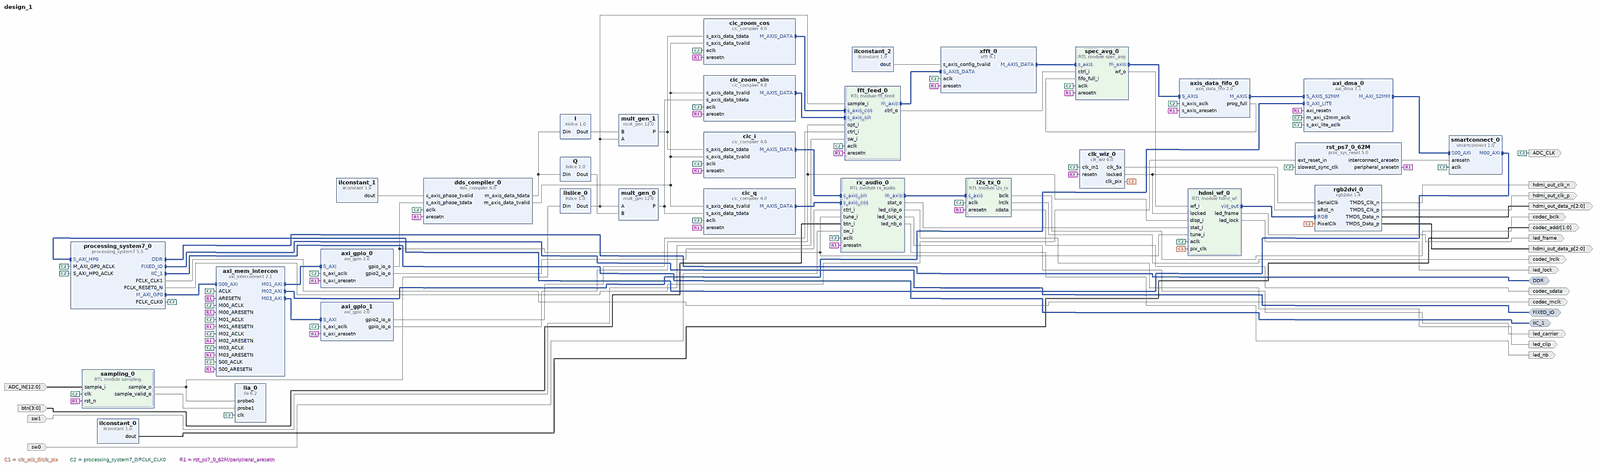
[diagram p0: block diagram of the top level, whole]
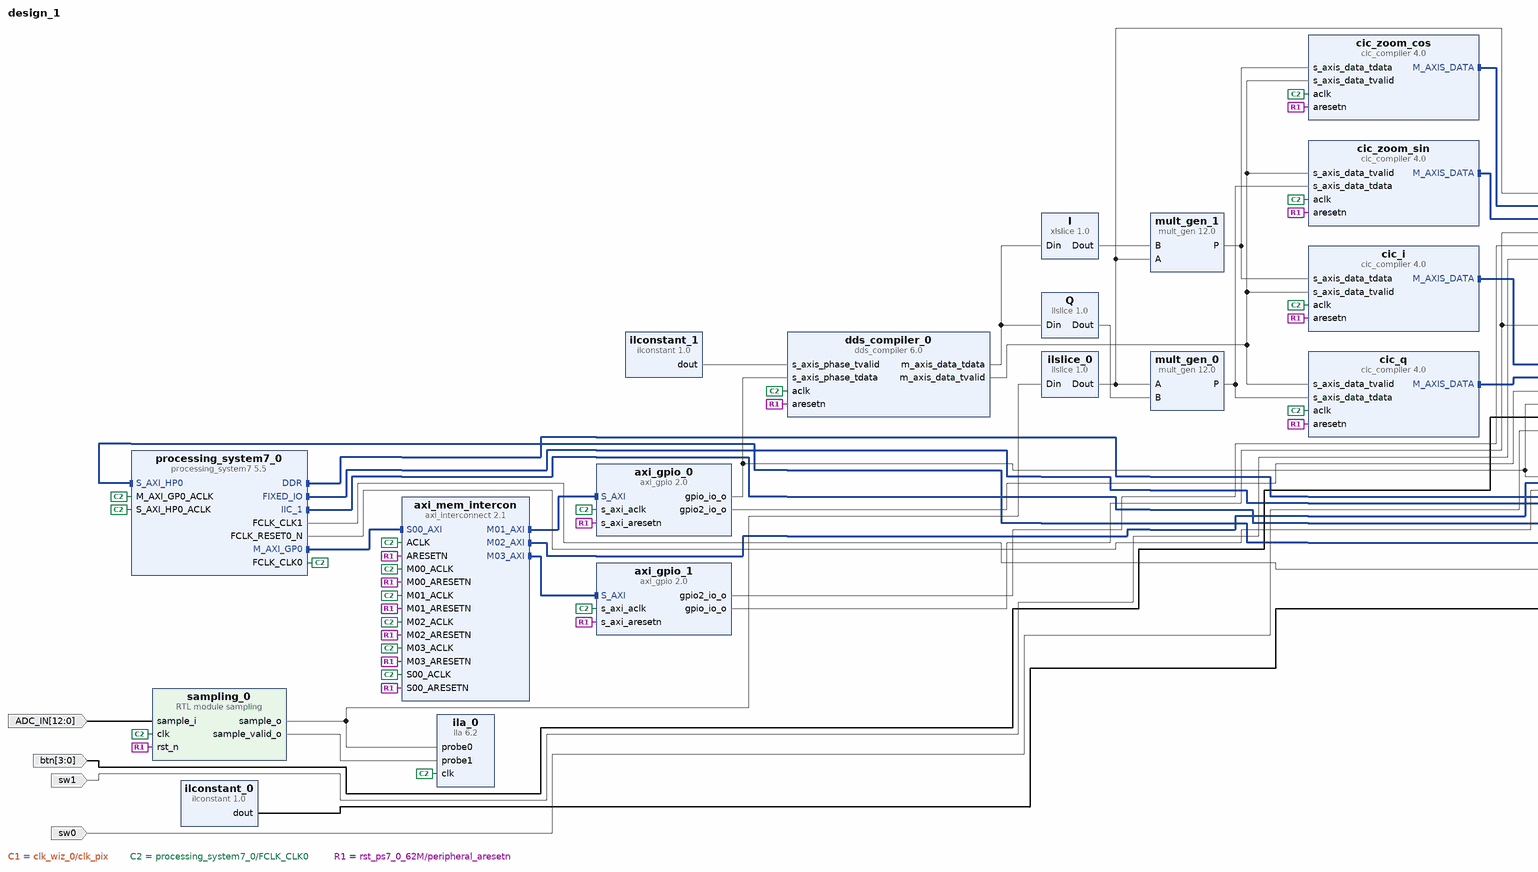
[diagram p1: block diagram of the top level, left part]
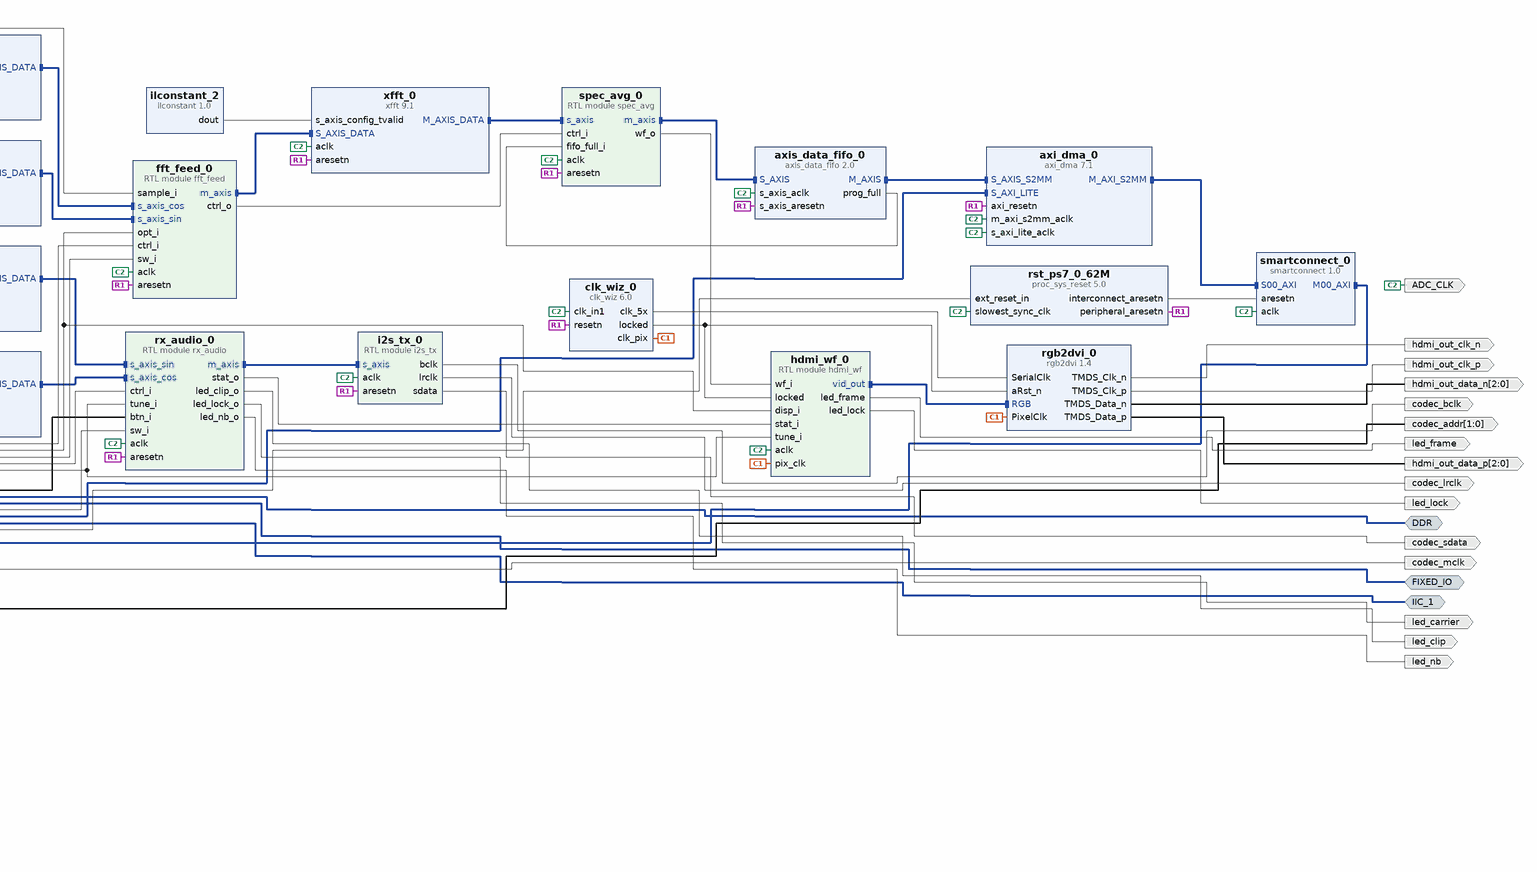
[diagram p2: block diagram of the top level, right part]
# Vivado block design design_1, xc7z020clg400-1, Vivado 2025.2
create_bd_design design_1

create_bd_intf_port -mode Master -vlnv xilinx.com:interface:ddrx_rtl:1.0 DDR
create_bd_intf_port -mode Master -vlnv xilinx.com:display_processing_system7:fixedio_rtl:1.0 FIXED_IO
create_bd_intf_port -mode Master -vlnv xilinx.com:interface:iic_rtl:1.0 IIC_1
create_bd_port -dir I -from 12 -to 0 -type data ADC_IN
create_bd_port -dir O ADC_CLK
create_bd_port -dir O codec_bclk
create_bd_port -dir O codec_lrclk
create_bd_port -dir O codec_sdata
create_bd_port -dir O -from 1 -to 0 codec_addr
create_bd_port -dir O codec_mclk
create_bd_port -dir O -type clk hdmi_out_clk_p
create_bd_port -dir O -type clk hdmi_out_clk_n
create_bd_port -dir O -from 2 -to 0 hdmi_out_data_p
create_bd_port -dir O -from 2 -to 0 hdmi_out_data_n
create_bd_port -dir O led_lock
create_bd_port -dir O led_frame
create_bd_port -dir I sw1
create_bd_port -dir I -from 3 -to 0 btn
create_bd_port -dir O led_carrier
create_bd_port -dir O led_clip
create_bd_port -dir I sw0
create_bd_port -dir O led_nb

create_bd_cell -type ip -vlnv xilinx.com:ip:processing_system7:5.5 processing_system7_0
set_property -dict [list \
  CONFIG.PCW_APU_PERIPHERAL_FREQMHZ 650 \
  CONFIG.PCW_CRYSTAL_PERIPHERAL_FREQMHZ 50 \
  CONFIG.PCW_ENET0_ENET0_IO {MIO 16 .. 27} \
  CONFIG.PCW_ENET0_GRP_MDIO_ENABLE 1 \
  CONFIG.PCW_ENET0_GRP_MDIO_IO {MIO 52 .. 53} \
  CONFIG.PCW_ENET0_PERIPHERAL_ENABLE 1 \
  CONFIG.PCW_ENET0_RESET_ENABLE 1 \
  CONFIG.PCW_ENET0_RESET_IO {MIO 9} \
  CONFIG.PCW_ENET_RESET_ENABLE 1 \
  CONFIG.PCW_ENET_RESET_SELECT {Share reset pin} \
  CONFIG.PCW_EN_CLK1_PORT 1 \
  CONFIG.PCW_FPGA0_PERIPHERAL_FREQMHZ 62.5 \
  CONFIG.PCW_FPGA1_PERIPHERAL_FREQMHZ 12.5 \
  CONFIG.PCW_FPGA_FCLK1_ENABLE 1 \
  CONFIG.PCW_GPIO_MIO_GPIO_ENABLE 1 \
  CONFIG.PCW_GPIO_MIO_GPIO_IO MIO \
  CONFIG.PCW_I2C1_I2C1_IO EMIO \
  CONFIG.PCW_I2C1_PERIPHERAL_ENABLE 1 \
  CONFIG.PCW_I2C_PERIPHERAL_FREQMHZ 108.333336 \
  CONFIG.PCW_I2C_RESET_ENABLE 1 \
  CONFIG.PCW_I2C_RESET_SELECT {Share reset pin} \
  CONFIG.PCW_M_AXI_GP0_FREQMHZ 10 \
  CONFIG.PCW_PERIPHERAL_BOARD_PRESET part0 \
  CONFIG.PCW_PRESET_BANK1_VOLTAGE {LVCMOS 1.8V} \
  CONFIG.PCW_QSPI_GRP_FBCLK_ENABLE 1 \
  CONFIG.PCW_QSPI_GRP_FBCLK_IO {MIO 8} \
  CONFIG.PCW_QSPI_GRP_SINGLE_SS_ENABLE 1 \
  CONFIG.PCW_QSPI_GRP_SINGLE_SS_IO {MIO 1 .. 6} \
  CONFIG.PCW_QSPI_PERIPHERAL_ENABLE 1 \
  CONFIG.PCW_QSPI_QSPI_IO {MIO 1 .. 6} \
  CONFIG.PCW_SD0_GRP_CD_ENABLE 1 \
  CONFIG.PCW_SD0_GRP_CD_IO {MIO 47} \
  CONFIG.PCW_SD0_GRP_WP_ENABLE 0 \
  CONFIG.PCW_SD0_PERIPHERAL_ENABLE 1 \
  CONFIG.PCW_SD0_SD0_IO {MIO 40 .. 45} \
  CONFIG.PCW_SDIO_PERIPHERAL_FREQMHZ 50 \
  CONFIG.PCW_SINGLE_QSPI_DATA_MODE x4 \
  CONFIG.PCW_UART0_PERIPHERAL_ENABLE 1 \
  CONFIG.PCW_UART0_UART0_IO {MIO 14 .. 15} \
  CONFIG.PCW_UART1_PERIPHERAL_ENABLE 0 \
  CONFIG.PCW_UART_PERIPHERAL_FREQMHZ 100 \
  CONFIG.PCW_UIPARAM_DDR_BUS_WIDTH {16 Bit} \
  CONFIG.PCW_UIPARAM_DDR_FREQ_MHZ 525 \
  CONFIG.PCW_UIPARAM_DDR_PARTNO {MT41J256M16 RE-125} \
  CONFIG.PCW_USB0_PERIPHERAL_ENABLE 1 \
  CONFIG.PCW_USB0_RESET_ENABLE 1 \
  CONFIG.PCW_USB0_RESET_IO {MIO 46} \
  CONFIG.PCW_USB0_USB0_IO {MIO 28 .. 39} \
  CONFIG.PCW_USB_RESET_ENABLE 1 \
  CONFIG.PCW_USB_RESET_SELECT {Share reset pin} \
  CONFIG.PCW_USE_S_AXI_HP0 1 \
] [get_bd_cells processing_system7_0]
# 482 more settings of processing_system7_0 are not shown: defaults, MIO pin electricals, DDR timing, and values the tool derives
create_bd_cell -type module -reference sampling sampling_0
create_bd_cell -type inline_hdl -vlnv xilinx.com:inline_hdl:ilslice:1.0 ilslice_0
set_property -dict {CONFIG.DIN_FROM 11 CONFIG.DIN_TO 0 CONFIG.DIN_WIDTH 13} [get_bd_cells ilslice_0]
create_bd_cell -type ip -vlnv xilinx.com:ip:proc_sys_reset:5.0 rst_ps7_0_62M
create_bd_cell -type ip -vlnv xilinx.com:ip:ila:6.2 ila_0
set_property -dict [list \
  CONFIG.C_DATA_DEPTH 8192 \
  CONFIG.C_EN_STRG_QUAL 1 \
  CONFIG.C_MONITOR_TYPE Native \
  CONFIG.C_NUM_OF_PROBES 2 \
] [get_bd_cells ila_0]
create_bd_cell -type ip -vlnv xilinx.com:ip:axi_interconnect:2.1 axi_mem_intercon
set_property -dict {CONFIG.NUM_MI 4 CONFIG.NUM_SI 1} [get_bd_cells axi_mem_intercon]
create_bd_cell -type ip -vlnv xilinx.com:ip:dds_compiler:6.0 dds_compiler_0
set_property -dict [list \
  CONFIG.DATA_Has_TLAST Not_Required \
  CONFIG.DDS_Clock_Rate 62.5 \
  CONFIG.DSP48_Use Maximal \
  CONFIG.Frequency_Resolution 0.4 \
  CONFIG.Has_ARESETn true \
  CONFIG.Has_Phase_Out false \
  CONFIG.Has_TREADY false \
  CONFIG.Latency 9 \
  CONFIG.M_DATA_Has_TUSER Not_Required \
  CONFIG.M_PHASE_Has_TUSER Not_Required \
  CONFIG.Noise_Shaping Taylor_Series_Corrected \
  CONFIG.OUTPUT_FORM Twos_Complement \
  CONFIG.Output_Frequency1 0 \
  CONFIG.Output_Width 16 \
  CONFIG.PINC1 0 \
  CONFIG.Parameter_Entry Hardware_Parameters \
  CONFIG.Phase_Increment Streaming \
  CONFIG.Phase_Width 32 \
  CONFIG.S_PHASE_Has_TUSER Not_Required \
] [get_bd_cells dds_compiler_0]
create_bd_cell -type ip -vlnv xilinx.com:ip:mult_gen:12.0 mult_gen_0
set_property -dict [list \
  CONFIG.Multiplier_Construction Use_Mults \
  CONFIG.OptGoal Speed \
  CONFIG.PipeStages 0 \
  CONFIG.PortAType Signed \
  CONFIG.PortAWidth 12 \
  CONFIG.PortBType Signed \
  CONFIG.PortBWidth 16 \
  CONFIG.Use_Custom_Output_Width false \
] [get_bd_cells mult_gen_0]
create_bd_cell -type ip -vlnv xilinx.com:ip:mult_gen:12.0 mult_gen_1
set_property -dict [list \
  CONFIG.Multiplier_Construction Use_Mults \
  CONFIG.OptGoal Speed \
  CONFIG.PipeStages 0 \
  CONFIG.PortAType Signed \
  CONFIG.PortAWidth 12 \
  CONFIG.PortBType Signed \
  CONFIG.PortBWidth 16 \
  CONFIG.Use_Custom_Output_Width false \
] [get_bd_cells mult_gen_1]
create_bd_cell -type inline_hdl -vlnv xilinx.com:inline_hdl:ilslice:1.0 Q
set_property -dict {CONFIG.DIN_FROM 31 CONFIG.DIN_TO 16} [get_bd_cells Q]
create_bd_cell -type ip -vlnv xilinx.com:ip:xlslice:1.0 I
set_property -dict {CONFIG.DIN_FROM 15 CONFIG.DOUT_WIDTH 16} [get_bd_cells I]
create_bd_cell -type ip -vlnv xilinx.com:ip:cic_compiler:4.0 cic_q
set_property -dict [list \
  CONFIG.Clock_Frequency 62.5 \
  CONFIG.Filter_Type Decimation \
  CONFIG.Fixed_Or_Initial_Rate 1280 \
  CONFIG.HAS_ARESETN true \
  CONFIG.Input_Data_Width 28 \
  CONFIG.Input_Sample_Frequency 62.5 \
  CONFIG.Maximum_Rate 1280 \
  CONFIG.Minimum_Rate 1280 \
  CONFIG.Number_Of_Stages 5 \
  CONFIG.Output_Data_Width 28 \
  CONFIG.Quantization Truncation \
  CONFIG.SamplePeriod 1 \
] [get_bd_cells cic_q]
create_bd_cell -type ip -vlnv xilinx.com:ip:cic_compiler:4.0 cic_i
set_property -dict [list \
  CONFIG.Clock_Frequency 62.5 \
  CONFIG.Filter_Type Decimation \
  CONFIG.Fixed_Or_Initial_Rate 1280 \
  CONFIG.HAS_ARESETN true \
  CONFIG.Input_Data_Width 28 \
  CONFIG.Input_Sample_Frequency 62.5 \
  CONFIG.Maximum_Rate 1280 \
  CONFIG.Minimum_Rate 1280 \
  CONFIG.Number_Of_Stages 5 \
  CONFIG.Output_Data_Width 28 \
  CONFIG.Quantization Truncation \
  CONFIG.SamplePeriod 1 \
] [get_bd_cells cic_i]
create_bd_cell -type module -reference i2s_tx i2s_tx_0
create_bd_cell -type inline_hdl -vlnv xilinx.com:inline_hdl:ilconstant:1.0 ilconstant_0
set_property -dict {CONFIG.CONST_VAL 3 CONFIG.CONST_WIDTH 2} [get_bd_cells ilconstant_0]
create_bd_cell -type ip -vlnv xilinx.com:ip:axi_gpio:2.0 axi_gpio_0
set_property -dict [list \
  CONFIG.C_ALL_OUTPUTS 1 \
  CONFIG.C_ALL_OUTPUTS_2 1 \
  CONFIG.C_GPIO2_WIDTH 16 \
  CONFIG.C_GPIO_WIDTH 32 \
  CONFIG.C_IS_DUAL 1 \
  CONFIG.GPIO_BOARD_INTERFACE Custom \
] [get_bd_cells axi_gpio_0]
create_bd_cell -type inline_hdl -vlnv xilinx.com:inline_hdl:ilconstant:1.0 ilconstant_1
create_bd_cell -type ip -vlnv xilinx.com:ip:axi_dma:7.1 axi_dma_0
set_property -dict {CONFIG.c_include_mm2s 0 CONFIG.c_include_sg 0 CONFIG.c_sg_length_width 26} [get_bd_cells axi_dma_0]
create_bd_cell -type ip -vlnv xilinx.com:ip:axis_data_fifo:2.0 axis_data_fifo_0
set_property -dict {CONFIG.FIFO_DEPTH 8192 CONFIG.HAS_PROG_FULL 1 CONFIG.PROG_FULL_THRESH 4096} [get_bd_cells axis_data_fifo_0]
create_bd_cell -type module -reference fft_feed fft_feed_0
create_bd_cell -type ip -vlnv xilinx.com:ip:xfft:9.1 xfft_0
set_property -dict [list \
  CONFIG.aresetn true \
  CONFIG.implementation_options pipelined_streaming_io \
  CONFIG.input_width 24 \
  CONFIG.number_of_stages_using_block_ram_for_data_and_phase_factors 5 \
  CONFIG.output_ordering natural_order \
  CONFIG.scaling_options unscaled \
  CONFIG.super_sample_rates 1 \
  CONFIG.target_clock_frequency 62 \
  CONFIG.transform_length 4096 \
  CONFIG.xk_index true \
] [get_bd_cells xfft_0]
create_bd_cell -type inline_hdl -vlnv xilinx.com:inline_hdl:ilconstant:1.0 ilconstant_2
set_property -dict {CONFIG.CONST_VAL 0} [get_bd_cells ilconstant_2]
create_bd_cell -type ip -vlnv xilinx.com:ip:axi_gpio:2.0 axi_gpio_1
set_property -dict [list \
  CONFIG.C_ALL_OUTPUTS 1 \
  CONFIG.C_ALL_OUTPUTS_2 1 \
  CONFIG.C_GPIO2_WIDTH 5 \
  CONFIG.C_GPIO_WIDTH 16 \
  CONFIG.C_IS_DUAL 1 \
] [get_bd_cells axi_gpio_1]
create_bd_cell -type module -reference spec_avg spec_avg_0
create_bd_cell -type ip -vlnv xilinx.com:ip:smartconnect:1.0 smartconnect_0
create_bd_cell -type ip -vlnv xilinx.com:ip:clk_wiz:6.0 clk_wiz_0
set_property -dict [list \
  CONFIG.CLKIN1_JITTER_PS 160.0 \
  CONFIG.CLKIN2_JITTER_PS 266.65 \
  CONFIG.CLKOUT1_JITTER 144.676 \
  CONFIG.CLKOUT1_PHASE_ERROR 190.503 \
  CONFIG.CLKOUT1_REQUESTED_OUT_FREQ 371.09375 \
  CONFIG.CLKOUT2_JITTER 186.752 \
  CONFIG.CLKOUT2_PHASE_ERROR 190.503 \
  CONFIG.CLKOUT2_REQUESTED_OUT_FREQ 74.21875 \
  CONFIG.CLKOUT2_USED true \
  CONFIG.CLK_OUT1_PORT clk_5x \
  CONFIG.CLK_OUT2_PORT clk_pix \
  CONFIG.MMCM_CLKFBOUT_MULT_F 35.625 \
  CONFIG.MMCM_CLKIN1_PERIOD 16.000 \
  CONFIG.MMCM_CLKIN2_PERIOD 10.0 \
  CONFIG.MMCM_CLKOUT0_DIVIDE_F 3.000 \
  CONFIG.MMCM_CLKOUT1_DIVIDE 15 \
  CONFIG.MMCM_DIVCLK_DIVIDE 2 \
  CONFIG.NUM_OUT_CLKS 2 \
  CONFIG.PRIM_IN_FREQ 62.5 \
  CONFIG.PRIM_SOURCE No_buffer \
  CONFIG.RESET_PORT resetn \
  CONFIG.RESET_TYPE ACTIVE_LOW \
  CONFIG.SECONDARY_IN_FREQ 100.000 \
  CONFIG.SECONDARY_SOURCE Single_ended_clock_capable_pin \
  CONFIG.USE_INCLK_SWITCHOVER false \
] [get_bd_cells clk_wiz_0]
create_bd_cell -type ip -vlnv digilentinc.com:ip:rgb2dvi:1.4 rgb2dvi_0
set_property -dict {CONFIG.kGenerateSerialClk false CONFIG.kRstActiveHigh false} [get_bd_cells rgb2dvi_0]
create_bd_cell -type module -reference hdmi_wf hdmi_wf_0
create_bd_cell -type ip -vlnv xilinx.com:ip:cic_compiler:4.0 cic_zoom_sin
set_property -dict [list \
  CONFIG.Clock_Frequency 62.5 \
  CONFIG.Filter_Type Decimation \
  CONFIG.Fixed_Or_Initial_Rate 256 \
  CONFIG.HAS_ARESETN true \
  CONFIG.Input_Data_Width 28 \
  CONFIG.Input_Sample_Frequency 62.5 \
  CONFIG.Maximum_Rate 256 \
  CONFIG.Minimum_Rate 256 \
  CONFIG.Number_Of_Stages 6 \
  CONFIG.Output_Data_Width 28 \
  CONFIG.Quantization Truncation \
  CONFIG.SamplePeriod 1 \
] [get_bd_cells cic_zoom_sin]
create_bd_cell -type ip -vlnv xilinx.com:ip:cic_compiler:4.0 cic_zoom_cos
set_property -dict [list \
  CONFIG.Clock_Frequency 62.5 \
  CONFIG.Filter_Type Decimation \
  CONFIG.Fixed_Or_Initial_Rate 256 \
  CONFIG.HAS_ARESETN true \
  CONFIG.Input_Data_Width 28 \
  CONFIG.Input_Sample_Frequency 62.5 \
  CONFIG.Maximum_Rate 256 \
  CONFIG.Minimum_Rate 256 \
  CONFIG.Number_Of_Stages 6 \
  CONFIG.Output_Data_Width 28 \
  CONFIG.Quantization Truncation \
  CONFIG.SamplePeriod 1 \
] [get_bd_cells cic_zoom_cos]
create_bd_cell -type module -reference rx_audio rx_audio_0

# ---- connections ----

connect_bd_intf_net [get_bd_intf_pins axi_dma_0/M_AXI_S2MM] [get_bd_intf_pins smartconnect_0/S00_AXI]
connect_bd_intf_net [get_bd_intf_pins axi_mem_intercon/M01_AXI] [get_bd_intf_pins axi_gpio_0/S_AXI]
connect_bd_intf_net [get_bd_intf_pins axi_mem_intercon/M02_AXI] [get_bd_intf_pins axi_dma_0/S_AXI_LITE]
connect_bd_intf_net [get_bd_intf_pins axi_mem_intercon/M03_AXI] [get_bd_intf_pins axi_gpio_1/S_AXI]
connect_bd_intf_net [get_bd_intf_pins axis_data_fifo_0/M_AXIS] [get_bd_intf_pins axi_dma_0/S_AXIS_S2MM]
connect_bd_intf_net [get_bd_intf_pins cic_i/M_AXIS_DATA] [get_bd_intf_pins rx_audio_0/s_axis_sin]
connect_bd_intf_net [get_bd_intf_pins cic_q/M_AXIS_DATA] [get_bd_intf_pins rx_audio_0/s_axis_cos]
connect_bd_intf_net [get_bd_intf_pins cic_zoom_cos/M_AXIS_DATA] [get_bd_intf_pins fft_feed_0/s_axis_cos]
connect_bd_intf_net [get_bd_intf_pins cic_zoom_sin/M_AXIS_DATA] [get_bd_intf_pins fft_feed_0/s_axis_sin]
connect_bd_intf_net [get_bd_intf_pins fft_feed_0/m_axis] [get_bd_intf_pins xfft_0/S_AXIS_DATA]
connect_bd_intf_net [get_bd_intf_pins hdmi_wf_0/vid_out] [get_bd_intf_pins rgb2dvi_0/RGB]
connect_bd_intf_net [get_bd_intf_ports DDR] [get_bd_intf_pins processing_system7_0/DDR]
connect_bd_intf_net [get_bd_intf_ports FIXED_IO] [get_bd_intf_pins processing_system7_0/FIXED_IO]
connect_bd_intf_net [get_bd_intf_ports IIC_1] [get_bd_intf_pins processing_system7_0/IIC_1]
connect_bd_intf_net [get_bd_intf_pins processing_system7_0/M_AXI_GP0] [get_bd_intf_pins axi_mem_intercon/S00_AXI]
connect_bd_intf_net [get_bd_intf_pins rx_audio_0/m_axis] [get_bd_intf_pins i2s_tx_0/s_axis]
connect_bd_intf_net [get_bd_intf_pins smartconnect_0/M00_AXI] [get_bd_intf_pins processing_system7_0/S_AXI_HP0]
connect_bd_intf_net [get_bd_intf_pins spec_avg_0/m_axis] [get_bd_intf_pins axis_data_fifo_0/S_AXIS]
connect_bd_intf_net [get_bd_intf_pins xfft_0/M_AXIS_DATA] [get_bd_intf_pins spec_avg_0/s_axis]
connect_bd_net [get_bd_ports ADC_IN] [get_bd_pins sampling_0/sample_i]
connect_bd_net [get_bd_pins axi_gpio_0/gpio2_io_o] [get_bd_pins rx_audio_0/ctrl_i]
connect_bd_net [get_bd_pins axi_gpio_0/gpio_io_o] \
  [get_bd_pins dds_compiler_0/s_axis_phase_tdata] [get_bd_pins hdmi_wf_0/tune_i] [get_bd_pins rx_audio_0/tune_i]
connect_bd_net [get_bd_pins axi_gpio_1/gpio2_io_o] [get_bd_pins fft_feed_0/ctrl_i]
connect_bd_net [get_bd_pins axi_gpio_1/gpio_io_o] [get_bd_pins fft_feed_0/opt_i] [get_bd_pins hdmi_wf_0/disp_i]
connect_bd_net [get_bd_pins axis_data_fifo_0/prog_full] [get_bd_pins spec_avg_0/fifo_full_i]
connect_bd_net -net btn_i_0_1 [get_bd_ports btn] [get_bd_pins rx_audio_0/btn_i]
connect_bd_net [get_bd_pins clk_wiz_0/clk_5x] [get_bd_pins rgb2dvi_0/SerialClk]
connect_bd_net [get_bd_pins clk_wiz_0/clk_pix] [get_bd_pins rgb2dvi_0/PixelClk] [get_bd_pins hdmi_wf_0/pix_clk]
connect_bd_net [get_bd_pins clk_wiz_0/locked] [get_bd_pins rgb2dvi_0/aRst_n] [get_bd_pins hdmi_wf_0/locked]
connect_bd_net [get_bd_pins dds_compiler_0/m_axis_data_tdata] [get_bd_pins Q/Din] [get_bd_pins I/Din]
connect_bd_net [get_bd_pins dds_compiler_0/m_axis_data_tvalid] \
  [get_bd_pins cic_i/s_axis_data_tvalid] [get_bd_pins cic_q/s_axis_data_tvalid] [get_bd_pins cic_zoom_sin/s_axis_data_tvalid] \
  [get_bd_pins cic_zoom_cos/s_axis_data_tvalid]
connect_bd_net [get_bd_pins fft_feed_0/ctrl_o] [get_bd_pins spec_avg_0/ctrl_i]
connect_bd_net [get_bd_pins hdmi_wf_0/led_frame] [get_bd_ports led_frame]
connect_bd_net [get_bd_pins hdmi_wf_0/led_lock] [get_bd_ports led_lock]
connect_bd_net [get_bd_pins i2s_tx_0/bclk] [get_bd_ports codec_bclk]
connect_bd_net [get_bd_pins i2s_tx_0/lrclk] [get_bd_ports codec_lrclk]
connect_bd_net [get_bd_pins i2s_tx_0/sdata] [get_bd_ports codec_sdata]
connect_bd_net [get_bd_pins ilconstant_0/dout] [get_bd_ports codec_addr]
connect_bd_net [get_bd_pins ilconstant_1/dout] [get_bd_pins dds_compiler_0/s_axis_phase_tvalid]
connect_bd_net [get_bd_pins ilconstant_2/dout] [get_bd_pins xfft_0/s_axis_config_tvalid]
connect_bd_net [get_bd_pins ilslice_0/Dout] [get_bd_pins mult_gen_0/A] [get_bd_pins mult_gen_1/A] [get_bd_pins fft_feed_0/sample_i]
connect_bd_net -net ilslice_1_Dout [get_bd_pins Q/Dout] [get_bd_pins mult_gen_0/B]
connect_bd_net [get_bd_pins mult_gen_0/P] [get_bd_pins cic_q/s_axis_data_tdata] [get_bd_pins cic_zoom_sin/s_axis_data_tdata]
connect_bd_net [get_bd_pins mult_gen_1/P] [get_bd_pins cic_i/s_axis_data_tdata] [get_bd_pins cic_zoom_cos/s_axis_data_tdata]
connect_bd_net [get_bd_pins processing_system7_0/FCLK_CLK0] \
  [get_bd_pins processing_system7_0/M_AXI_GP0_ACLK] [get_bd_pins rst_ps7_0_62M/slowest_sync_clk] [get_bd_pins ila_0/clk] \
  [get_bd_ports ADC_CLK] [get_bd_pins axi_mem_intercon/S00_ACLK] [get_bd_pins processing_system7_0/S_AXI_HP0_ACLK] \
  [get_bd_pins axi_mem_intercon/M00_ACLK] [get_bd_pins axi_mem_intercon/ACLK] [get_bd_pins sampling_0/clk] \
  [get_bd_pins cic_i/aclk] [get_bd_pins dds_compiler_0/aclk] [get_bd_pins cic_q/aclk] [get_bd_pins i2s_tx_0/aclk] \
  [get_bd_pins axi_gpio_0/s_axi_aclk] [get_bd_pins axi_mem_intercon/M01_ACLK] [get_bd_pins axi_dma_0/m_axi_s2mm_aclk] \
  [get_bd_pins axi_dma_0/s_axi_lite_aclk] [get_bd_pins axi_mem_intercon/M02_ACLK] [get_bd_pins xfft_0/aclk] \
  [get_bd_pins axis_data_fifo_0/s_axis_aclk] [get_bd_pins axi_gpio_1/s_axi_aclk] [get_bd_pins axi_mem_intercon/M03_ACLK] \
  [get_bd_pins smartconnect_0/aclk] [get_bd_pins clk_wiz_0/clk_in1] [get_bd_pins fft_feed_0/aclk] \
  [get_bd_pins spec_avg_0/aclk] [get_bd_pins cic_zoom_sin/aclk] [get_bd_pins cic_zoom_cos/aclk] [get_bd_pins hdmi_wf_0/aclk] \
  [get_bd_pins rx_audio_0/aclk]
connect_bd_net [get_bd_pins processing_system7_0/FCLK_CLK1] [get_bd_ports codec_mclk]
connect_bd_net [get_bd_pins processing_system7_0/FCLK_RESET0_N] [get_bd_pins rst_ps7_0_62M/ext_reset_in]
connect_bd_net [get_bd_pins rgb2dvi_0/TMDS_Clk_n] [get_bd_ports hdmi_out_clk_n]
connect_bd_net [get_bd_pins rgb2dvi_0/TMDS_Clk_p] [get_bd_ports hdmi_out_clk_p]
connect_bd_net [get_bd_pins rgb2dvi_0/TMDS_Data_n] [get_bd_ports hdmi_out_data_n]
connect_bd_net [get_bd_pins rgb2dvi_0/TMDS_Data_p] [get_bd_ports hdmi_out_data_p]
connect_bd_net [get_bd_pins rst_ps7_0_62M/interconnect_aresetn] [get_bd_pins smartconnect_0/aresetn]
connect_bd_net [get_bd_pins rst_ps7_0_62M/peripheral_aresetn] \
  [get_bd_pins axi_mem_intercon/S00_ARESETN] [get_bd_pins axi_mem_intercon/M00_ARESETN] \
  [get_bd_pins axi_mem_intercon/ARESETN] [get_bd_pins sampling_0/rst_n] [get_bd_pins cic_i/aresetn] \
  [get_bd_pins dds_compiler_0/aresetn] [get_bd_pins cic_q/aresetn] [get_bd_pins i2s_tx_0/aresetn] \
  [get_bd_pins axi_gpio_0/s_axi_aresetn] [get_bd_pins axi_mem_intercon/M01_ARESETN] [get_bd_pins axi_dma_0/axi_resetn] \
  [get_bd_pins axi_mem_intercon/M02_ARESETN] [get_bd_pins xfft_0/aresetn] [get_bd_pins axis_data_fifo_0/s_axis_aresetn] \
  [get_bd_pins axi_gpio_1/s_axi_aresetn] [get_bd_pins axi_mem_intercon/M03_ARESETN] [get_bd_pins clk_wiz_0/resetn] \
  [get_bd_pins fft_feed_0/aresetn] [get_bd_pins spec_avg_0/aresetn] [get_bd_pins cic_zoom_cos/aresetn] \
  [get_bd_pins cic_zoom_sin/aresetn] [get_bd_pins rx_audio_0/aresetn]
connect_bd_net [get_bd_pins rx_audio_0/led_clip_o] [get_bd_ports led_clip]
connect_bd_net [get_bd_pins rx_audio_0/led_lock_o] [get_bd_ports led_carrier]
connect_bd_net [get_bd_pins rx_audio_0/led_nb_o] [get_bd_ports led_nb]
connect_bd_net [get_bd_pins rx_audio_0/stat_o] [get_bd_pins hdmi_wf_0/stat_i]
connect_bd_net [get_bd_pins sampling_0/sample_o] [get_bd_pins ilslice_0/Din] [get_bd_pins ila_0/probe0]
connect_bd_net [get_bd_pins sampling_0/sample_valid_o] [get_bd_pins ila_0/probe1]
connect_bd_net [get_bd_pins spec_avg_0/wf_o] [get_bd_pins hdmi_wf_0/wf_i]
connect_bd_net -net sw_i_0_1 [get_bd_ports sw1] [get_bd_pins fft_feed_0/sw_i]
connect_bd_net -net sw_i_0_2 [get_bd_ports sw0] [get_bd_pins rx_audio_0/sw_i]
connect_bd_net -net xlslice_0_Dout [get_bd_pins I/Dout] [get_bd_pins mult_gen_1/B]

# ---- address map ----
assign_bd_address -offset 0x00000000 -range 512M -target_address_space [get_bd_addr_spaces axi_dma_0/Data_S2MM] [get_bd_addr_segs processing_system7_0/S_AXI_HP0/HP0_DDR_LOWOCM]
exclude_bd_addr_seg -offset 0x40400000 -range 64K -target_address_space [get_bd_addr_spaces axi_dma_0/Data_S2MM] [get_bd_addr_segs axi_dma_0/S_AXI_LITE/Reg]
exclude_bd_addr_seg -offset 0x41200000 -range 64K -target_address_space [get_bd_addr_spaces axi_dma_0/Data_S2MM] [get_bd_addr_segs axi_gpio_0/S_AXI/Reg]
exclude_bd_addr_seg -offset 0x41210000 -range 64K -target_address_space [get_bd_addr_spaces axi_dma_0/Data_S2MM] [get_bd_addr_segs axi_gpio_1/S_AXI/Reg]
assign_bd_address -offset 0x40400000 -range 64K -target_address_space [get_bd_addr_spaces processing_system7_0/Data] [get_bd_addr_segs axi_dma_0/S_AXI_LITE/Reg]
assign_bd_address -offset 0x41200000 -range 64K -target_address_space [get_bd_addr_spaces processing_system7_0/Data] [get_bd_addr_segs axi_gpio_0/S_AXI/Reg]
assign_bd_address -offset 0x41210000 -range 64K -target_address_space [get_bd_addr_spaces processing_system7_0/Data] [get_bd_addr_segs axi_gpio_1/S_AXI/Reg]
exclude_bd_addr_seg -offset 0x00000000 -range 1 -target_address_space [get_bd_addr_spaces processing_system7_0/Data] [get_bd_addr_segs processing_system7_0/S_AXI_HP0/HP0_DDR_LOWOCM]

validate_bd_design
save_bd_design
